# Altium schematic sheet Top_Sheet.SchDoc
size A4; SheetNumber: 1; SheetTotal: 6
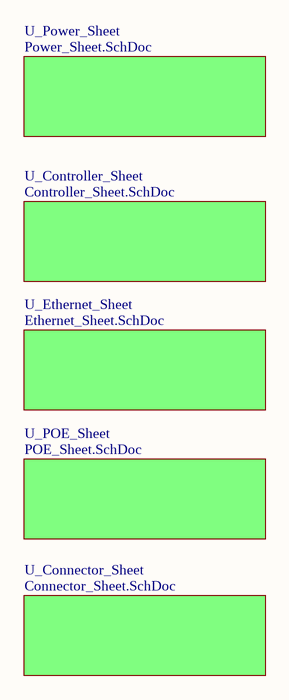
[diagram p0: Top_Sheet.SchDoc]

## Sub-sheets
U_Connector_Sheet = Connector_Sheet.SchDoc: no entries
U_Controller_Sheet = Controller_Sheet.SchDoc: no entries
U_Ethernet_Sheet = Ethernet_Sheet.SchDoc: no entries
U_POE_Sheet = POE_Sheet.SchDoc: no entries
U_Power_Sheet = Power_Sheet.SchDoc: no entries

## Notes on the sheet
- File:
- Title:
- Date:
- Page
- Num:
- Total:
- Drawn By: Huzaifa Ali